# Altium schematic sheet Transform_12_310.SchDoc
size C; SheetNumber: 4; SheetTotal: 9
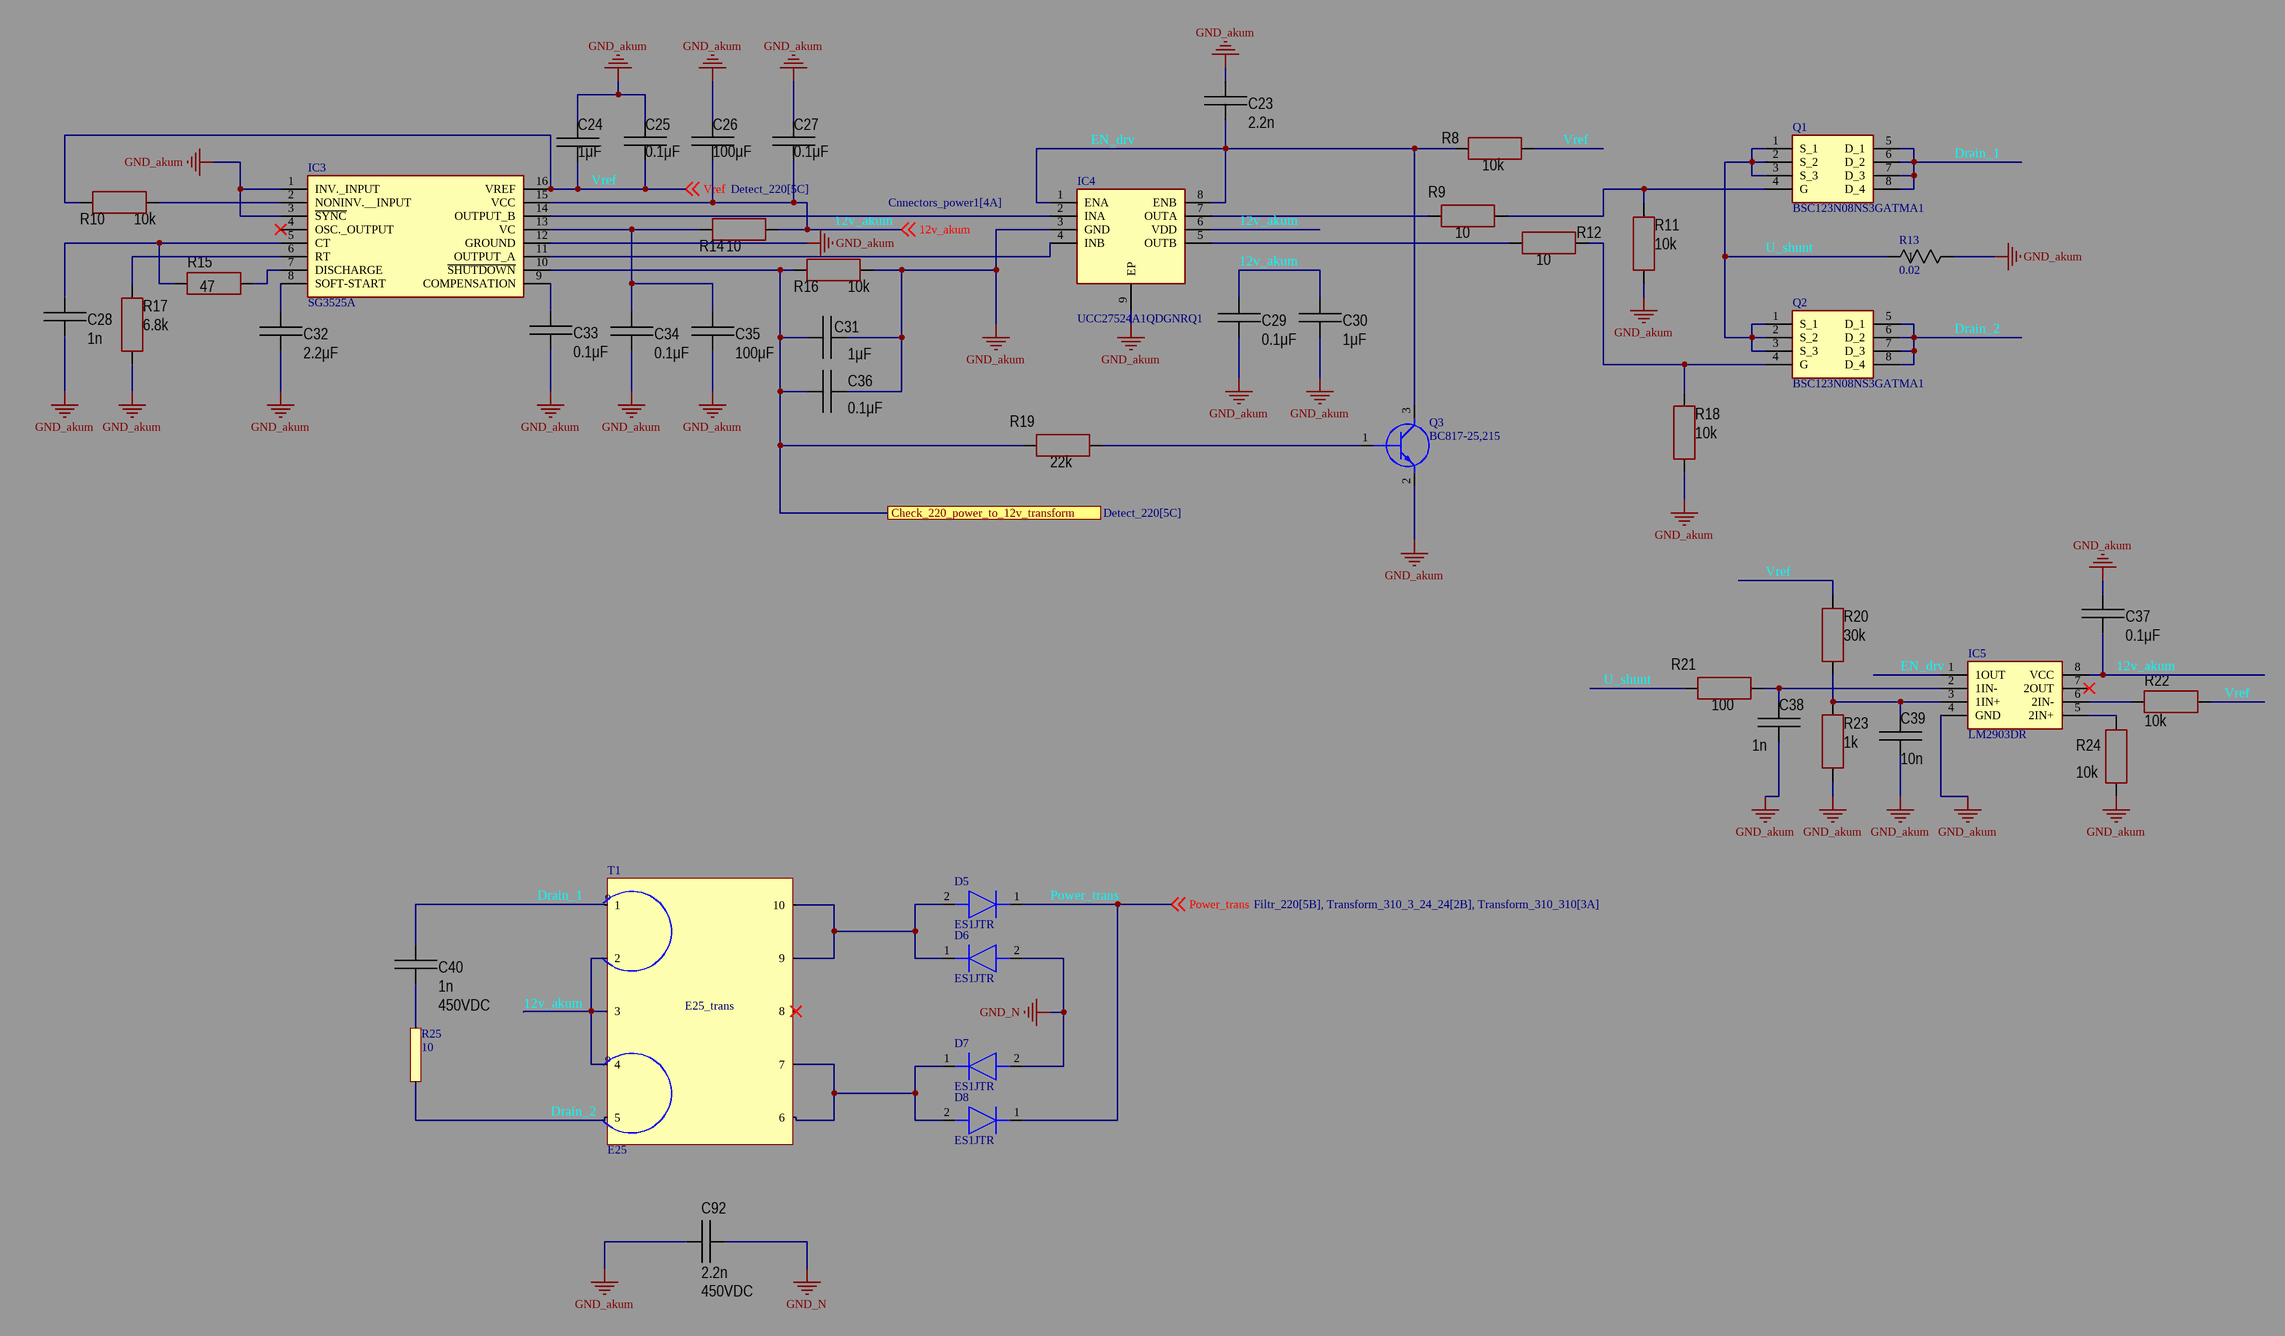
[diagram p0: Transform_12_310.SchDoc]

## Parts
C23  value 2.2n  [CAP: 1206]
C24  value 1μF  [CAP: 1206]
C25  value 0.1μF  [CAP: 1206]
C26  value 100μF  [CAP: 1206]
C27  value 0.1μF  [CAP: 1206]
C28  value 1n  [CAP: 1206]
C29  value 0.1μF  [CAP: 1206]
C30  value 1μF  [CAP: 1206]
C31  value 1μF  [CAP: 1206]
C32  value 2.2μF  [CAP: 1206]
C33  value 0.1μF  [CAP: 1206]
C34  value 0.1μF  [CAP: 1206]
C35  value 100μF  [CAP: 1206]
C36  value 0.1μF  [CAP: 1206]
C37  value 0.1μF  [CAP: 1206]
C38  value 1n  [CAP: 1206]
C39  value 10n  [CAP: 1206]
C40  value 1n  Voltage: 450VDC  [CAP: AY2102M29Y5US63L7]
C92  value 2.2n  Voltage: 450VDC  [CAP: AY2102M29Y5US63L7]
D5  ES1JTR  [DIOM5226X295N]
D6  ES1JTR  [DIOM5226X295N]
D7  ES1JTR  [DIOM5226X295N]
D8  ES1JTR  [DIOM5226X295N]
IC3  SG3525A  [SOIC127P1030X265-16N]
IC4  UCC27524A1QDGNRQ1  [SOP65P490X110-9N]
IC5  LM2903DR  [SOIC127P600X175-8N]
Q1  BSC123N08NS3GATMA1  [PG-TDSON-8]
Q2  BSC123N08NS3GATMA1  [PG-TDSON-8]
Q3  BC817-25,215  [BC81725215]
R8  value 10k  [RES: 1206]
R9  value 10  [RES: 1206]
R10  value 10k  [RES: 1206]
R11  value 10k  [RES: 1206]
R12  value 10  [RES: 1206]
R13  0.02  [RES_BPR58-STRAIGHT_KOA]
R14  value 10  [RES: 1206]
R15  value 47  [RES: 1206]
R16  value 10k  [RES: 1206]
R17  value 6.8k  [RES: 1206]
R18  value 10k  [RES: 1206]
R19  value 22k  [RES: 1206]
R20  value 30k  [RES: 1206]
R21  value 100  [RES: 1206]
R22  value 10k  [RES: 1206]
R23  value 1k  [RES: 1206]
R24  value 10k  [RES: 1206]
R25  10  [THT_R_6mm_1]
T1  E25  [E25]

## Ports
Check_220_power_to_12v_transform (see Detect_220[5C])

## Nets
GND_akum: C23.2 C24.1 C25.2 C26.2 C27.2 C28.1 C29.2 C30.2 C31.1 C32.2 C33.2 C34.2 C35.2 C36.1 C37.2 C38.2 C39.2 C92.1 IC3.1(INV._INPUT) IC3.3(~{SYNC}) IC3.12(GROUND) IC4.3(GND) IC4.9(EP) IC5.4(GND) Q3.2(E) R11.1 R13.2 R16.2 R17.1 R18.1 R23.1 R24.1
GND_N: C92.2 D6.2(A) D7.2(A)
12v_akum: C26.1 C27.1 C29.1 C30.1 C37.1 IC3.15(VCC) IC4.6(VDD) IC5.8(VCC) R14.2 T1.2 T1.3 T1.4 ; off-sheet 12v_akum
Check_220_power_to_12v_transform: C31.2 C36.2 IC3.10(~{SHUTDOWN}) R16.1 R19.1 ; port Check_220_power_to_12v_transform
Drain_1: C40.1 Q1.5(D_1) Q1.6(D_2) Q1.7(D_3) Q1.8(D_4) T1.1
Drain_2: Q2.5(D_1) Q2.6(D_2) Q2.7(D_3) Q2.8(D_4) R25.1 T1.5
EN_drv: C23.1 IC4.1(ENA) IC4.8(ENB) IC5.1(1OUT) Q3.3(C) R8.1
Power_trans: D5.1(K) D8.1(K) ; off-sheet Power_trans
U_shunt: Q1.1(S_1) Q1.2(S_2) Q1.3(S_3) Q2.1(S_1) Q2.2(S_2) Q2.3(S_3) R13.1 R21.1
Vref: C24.2 C25.1 IC3.16(VREF) R8.2 R10.1 R20.2 R22.1 ; off-sheet Vref
NetC28_2: C28.2 IC3.5(CT) R15.2
NetC32_1: C32.1 IC3.8(SOFT-START)
NetC33_1: C33.1 IC3.9(COMPENSATION)
NetC34_1: C34.1 C35.1 IC3.13(VC) R14.1
NetC38_1: C38.1 IC5.2(1IN-) R21.2
NetC39_1: C39.1 IC5.3(1IN+) R20.1 R23.2
NetC40_2: C40.2 R25.2
NetD5_2: D5.2(A) D6.1(K) T1.9 T1.10
NetD7_1: D7.1(K) D8.2(A) T1.6 T1.7
NetIC3_2: IC3.2(NONINV.__INPUT) R10.2
NetIC3_6: IC3.6(RT) R17.2
NetIC3_7: IC3.7(DISCHARGE) R15.1
NetIC3_11: IC3.11(OUTPUT_A) IC4.4(INB)
NetIC3_14: IC3.14(OUTPUT_B) IC4.2(INA)
NetIC4_5: IC4.5(OUTB) R12.1
NetIC4_7: IC4.7(OUTA) R9.1
NetIC5_5: IC5.5(2IN+) R24.2
NetIC5_6: IC5.6(2IN-) R22.2
NetQ1_4: Q1.4(G) R9.2 R11.2
NetQ2_4: Q2.4(G) R12.2 R18.2
NetQ3_1: Q3.1(B) R19.2

Not connected (* = marked no-connect by the designer): IC3 4(OSC._OUTPUT)*; IC5 7(2OUT)*; T1 8*

## Notes on the sheet
- (near T1) o
- (in symbol E25) E25_trans

## Library data of the parts
C23 = Ceramic_1206: Manufacturer: Yageo; PartNumber: CC1206KRX7R9BB104; ValueManufacturerPartNumber: Ceramic capacitor, 2.2n, X7R, ±10%, 50V, 1206, -55...+125°C; TypeCapacitor: Ceramic capacitor; Tolerance: ±10%; TypeDielectric: X7R; Voltage: 50V; Package: 1206; HelpURL: https://www.digikey.com/product-detail/en/yageo/CC1206KRX7R9BB104/311-1179-1-ND/303089; Temperature: -55...+125°C
C24 C30 C31 = Ceramic_1206: Manufacturer: Yageo; PartNumber: CC1206KRX7R9BB104; ValueManufacturerPartNumber: Ceramic capacitor, 1μF, X7R, ±10%, 50V, 1206, -55...+125°C; TypeCapacitor: Ceramic capacitor; Tolerance: ±10%; TypeDielectric: X7R; Voltage: 50V; Package: 1206; HelpURL: https://www.digikey.com/product-detail/en/yageo/CC1206KRX7R9BB104/311-1179-1-ND/303089; Temperature: -55...+125°C
C25 C27 C29 C33 C34 C36 C37 = Ceramic_1206: Manufacturer: Yageo; PartNumber: CC1206KRX7R9BB104; ValueManufacturerPartNumber: Ceramic capacitor, 0.1μF, X7R, ±10%, 50V, 1206, -55...+125°C; TypeCapacitor: Ceramic capacitor; Tolerance: ±10%; TypeDielectric: X7R; Voltage: 50V; Package: 1206; HelpURL: https://www.digikey.com/product-detail/en/yageo/CC1206KRX7R9BB104/311-1179-1-ND/303089; Temperature: -55...+125°C
C26 C35 = Ceramic_1206: Manufacturer: Yageo; PartNumber: CC1206KRX7R9BB104; ValueManufacturerPartNumber: Ceramic capacitor, 100μF, X7R, ±10%, 50V, 1206, -55...+125°C; TypeCapacitor: Ceramic capacitor; Tolerance: ±10%; TypeDielectric: X7R; Voltage: 50V; Package: 1206; HelpURL: https://www.digikey.com/product-detail/en/yageo/CC1206KRX7R9BB104/311-1179-1-ND/303089; Temperature: -55...+125°C
C28 C38 = Ceramic_1206: Manufacturer: Yageo; PartNumber: CC1206KRX7R9BB104; ValueManufacturerPartNumber: Ceramic capacitor, 1n, X7R, ±10%, 50V, 1206, -55...+125°C; TypeCapacitor: Ceramic capacitor; Tolerance: ±10%; TypeDielectric: X7R; Voltage: 50V; Package: 1206; HelpURL: https://www.digikey.com/product-detail/en/yageo/CC1206KRX7R9BB104/311-1179-1-ND/303089; Temperature: -55...+125°C
C32 = Ceramic_1206: Manufacturer: Yageo; PartNumber: CC1206KRX7R9BB104; ValueManufacturerPartNumber: Ceramic capacitor, 2.2μF, X7R, ±10%, 50V, 1206, -55...+125°C; TypeCapacitor: Ceramic capacitor; Tolerance: ±10%; TypeDielectric: X7R; Voltage: 50V; Package: 1206; HelpURL: https://www.digikey.com/product-detail/en/yageo/CC1206KRX7R9BB104/311-1179-1-ND/303089; Temperature: -55...+125°C
C39 = Ceramic_1206: Manufacturer: Yageo; PartNumber: CC1206KRX7R9BB104; ValueManufacturerPartNumber: Ceramic capacitor, 10n, X7R, ±10%, 50V, 1206, -55...+125°C; TypeCapacitor: Ceramic capacitor; Tolerance: ±10%; TypeDielectric: X7R; Voltage: 50V; Package: 1206; HelpURL: https://www.digikey.com/product-detail/en/yageo/CC1206KRX7R9BB104/311-1179-1-ND/303089; Temperature: -55...+125°C
C40 = Film: Manufacturer: Epcos; PartNumber: B32774D4106K000; ValueManufacturerPartNumber: Film capacitor, 1n, 450VDC, ±10%, 10.9mOhm, 31.5x15 mm, -40...+105°C; TypeCapacitor: Film capacitor; Tolerance: ±10%; Impedance: 10.9mOhm; Package: 31.5x15 mm; HelpURL: https://www.digikey.com/products/en/capacitors/film-capacitors/62?k=&pkeyword=&sv=0&pv2097=1958&sf=0&FV=fffc01ef%2C1f140000%2Cffe0003e%2Cffec6366&quantity=1&ColumnSort=1000011&page=1&stock=1&pageSize=25; Temperature: -40...+105°C
C92 = Film: Manufacturer: Epcos; PartNumber: B32774D4106K000; ValueManufacturerPartNumber: Film capacitor, 2.2n, 450VDC, ±10%, 10.9mOhm, 31.5x15 mm, -40...+105°C; TypeCapacitor: Film capacitor; Tolerance: ±10%; Impedance: 10.9mOhm; Package: 31.5x15 mm; HelpURL: https://www.digikey.com/products/en/capacitors/film-capacitors/62?k=&pkeyword=&sv=0&pv2097=1958&sf=0&FV=fffc01ef%2C1f140000%2Cffe0003e%2Cffec6366&quantity=1&ColumnSort=1000011&page=1&stock=1&pageSize=25; Temperature: -40...+105°C
D5-D8 = ES1JTR: Diode; Manufacturer_Name: SMC Diode Solutions; Datasheet Link: http://www.smc-diodes.com/propdf/ES1(A-M)%20N0159%20REV.E.pdf; Height: 2.95mm; Manufacturer_Part_Number: ES1JTR
IC3 = SG3525A: Integrated Circuit; Manufacturer_Name: onsemi; Datasheet Link: https://www.onsemi.com/pub/Collateral/SG3525A-D.PDF; Height: 2.65mm; Manufacturer_Part_Number: SG3525A; Mouser Part Number: N/A; Mouser Price/Stock: https://www.mouser.co.uk/ProductDetail/onsemi/SG3525A?qs=%252BEew9%252B0nqrDSSy3t2TCw8g%3D%3D
IC4 = UCC27524A1QDGNRQ1: Integrated Circuit; Manufacturer_Name: Texas Instruments; Datasheet Link: http://www.ti.com/lit/gpn/ucc27524a1-q1; Height: 1.1mm; Manufacturer_Part_Number: UCC27524A1QDGNRQ1; Mouser Part Number: 595-CC27524A1QDGNRQ1; Mouser Price/Stock: https://www.mouser.co.uk/ProductDetail/Texas-Instruments/UCC27524A1QDGNRQ1?qs=5aG0NVq1C4zKCNInVyVkfw%3D%3D; Arrow Part Number: UCC27524A1QDGNRQ1; Arrow Price/Stock: https://www.arrow.com/en/products/ucc27524a1qdgnrq1/texas-instruments.html?utm_currency=USD&region=nac
IC5 = LM2903DR: Integrated Circuit; Manufacturer_Name: Texas Instruments; Datasheet Link: http://www.ti.com/lit/ds/symlink/lm393.pdf; Height: 1.75mm; Manufacturer_Part_Number: LM2903DR; Mouser Part Number: 595-LM2903DR; Mouser Price/Stock: https://www.mouser.co.uk/ProductDetail/Texas-Instruments/LM2903DR?qs=6aLkNDRfRUZTZwd6enMTiA%3D%3D; Arrow Part Number: LM2903DR; Arrow Price/Stock: https://www.arrow.com/en/products/lm2903dr/texas-instruments?region=nac
Q1 Q2 = BSC123N08NS3GATMA1: MOSFET (N-Channel); Manufacturer_Name: Infineon; Datasheet Link: https://www.infineon.com/dgdl/Infineon-BSC123N08NS3G-DS-v02_05-en.pdf?fileId=db3a30431add1d95011ae80eb8555625; Manufacturer_Part_Number: BSC123N08NS3GATMA1; Mouser Part Number: 726-BSC123N08NS3GATM; Mouser Price/Stock: https://www.mouser.co.uk/ProductDetail/Infineon-Technologies/BSC123N08NS3GATMA1?qs=K00xGehIljtQ0xUH5qROpA%3D%3D; Arrow Part Number: BSC123N08NS3GATMA1; Arrow Price/Stock: https://www.arrow.com/en/products/bsc123n08ns3gatma1/infineon-technologies-ag.html?utm_currency=USD&region=asia
Q3 = BC817-25,215: Transistor BJT NPN; Manufacturer_Name: Nexperia; Datasheet Link: https://assets.nexperia.com/documents/data-sheet/BC817_SER.pdf; Height: 1.1mm; Manufacturer_Part_Number: BC817-25,215; Mouser Part Number: 771-BC817-25-T/R; Mouser Price/Stock: https://www.mouser.co.uk/ProductDetail/Nexperia/BC817-25215?qs=me8TqzrmIYUj67JkTBzlfg%3D%3D; Arrow Part Number: BC817-25,215; Arrow Price/Stock: https://www.arrow.com/en/products/bc817-25215/nexperia?region=nac
R8 R10 R11 R16 R18 R22 R24 = Resistor_1206: Manufacturer: Yageo; PartNumber: RC1206JR-07100RL; ValueManufacturerPartNumber: Resistor film, 10k, ±5%, 1206, 0.25W, -55...+125°C; TypeResistor: Resistor film; Power: 0.25W; Tolerance: ±5%; Package: 1206; HelpURL: https://www.digikey.com/product-detail/en/yageo/RC1206JR-07100RL/311-100ERCT-ND/732153; Temperature: -55...+125°C; Parameter 1: *
R9 R12 R14 = Resistor_1206: Manufacturer: Yageo; PartNumber: RC1206JR-07100RL; ValueManufacturerPartNumber: Resistor film, 10, ±5%, 1206, 0.25W, -55...+125°C; TypeResistor: Resistor film; Power: 0.25W; Tolerance: ±5%; Package: 1206; HelpURL: https://www.digikey.com/product-detail/en/yageo/RC1206JR-07100RL/311-100ERCT-ND/732153; Temperature: -55...+125°C; Parameter 1: *
R13 = BPR58CR10J: No Description Available; Manufacturer_Name: KOA Speer; Type: Through Hole Resistors; Copyright: Copyright (C) 2026 Ultra Librarian. All rights reserved.; Manufacturer_Part_Number: BPR58CR10J
R15 = Resistor_1206: Manufacturer: Yageo; PartNumber: RC1206JR-07100RL; ValueManufacturerPartNumber: Resistor film, 47, ±5%, 1206, 0.25W, -55...+125°C; TypeResistor: Resistor film; Power: 0.25W; Tolerance: ±5%; Package: 1206; HelpURL: https://www.digikey.com/product-detail/en/yageo/RC1206JR-07100RL/311-100ERCT-ND/732153; Temperature: -55...+125°C; Parameter 1: *
R17 = Resistor_1206: Manufacturer: Yageo; PartNumber: RC1206JR-07100RL; ValueManufacturerPartNumber: Resistor film, 6.8k, ±5%, 1206, 0.25W, -55...+125°C; TypeResistor: Resistor film; Power: 0.25W; Tolerance: ±5%; Package: 1206; HelpURL: https://www.digikey.com/product-detail/en/yageo/RC1206JR-07100RL/311-100ERCT-ND/732153; Temperature: -55...+125°C; Parameter 1: *
R19 = Resistor_1206: Manufacturer: Yageo; PartNumber: RC1206JR-07100RL; ValueManufacturerPartNumber: Resistor film, 22k, ±5%, 1206, 0.25W, -55...+125°C; TypeResistor: Resistor film; Power: 0.25W; Tolerance: ±5%; Package: 1206; HelpURL: https://www.digikey.com/product-detail/en/yageo/RC1206JR-07100RL/311-100ERCT-ND/732153; Temperature: -55...+125°C; Parameter 1: *
R20 = Resistor_1206: Manufacturer: Yageo; PartNumber: RC1206JR-07100RL; ValueManufacturerPartNumber: Resistor film, 30k, ±5%, 1206, 0.25W, -55...+125°C; TypeResistor: Resistor film; Power: 0.25W; Tolerance: ±5%; Package: 1206; HelpURL: https://www.digikey.com/product-detail/en/yageo/RC1206JR-07100RL/311-100ERCT-ND/732153; Temperature: -55...+125°C; Parameter 1: *
R21 = Resistor_1206: Manufacturer: Yageo; PartNumber: RC1206JR-07100RL; ValueManufacturerPartNumber: Resistor film, 100, ±5%, 1206, 0.25W, -55...+125°C; TypeResistor: Resistor film; Power: 0.25W; Tolerance: ±5%; Package: 1206; HelpURL: https://www.digikey.com/product-detail/en/yageo/RC1206JR-07100RL/311-100ERCT-ND/732153; Temperature: -55...+125°C; Parameter 1: *
R23 = Resistor_1206: Manufacturer: Yageo; PartNumber: RC1206JR-07100RL; ValueManufacturerPartNumber: Resistor film, 1k, ±5%, 1206, 0.25W, -55...+125°C; TypeResistor: Resistor film; Power: 0.25W; Tolerance: ±5%; Package: 1206; HelpURL: https://www.digikey.com/product-detail/en/yageo/RC1206JR-07100RL/311-100ERCT-ND/732153; Temperature: -55...+125°C; Parameter 1: *
R25 = THT_R_6mm_1